# Altium project Control-Board-v1.0.PrjPcb (part 6 of 7)
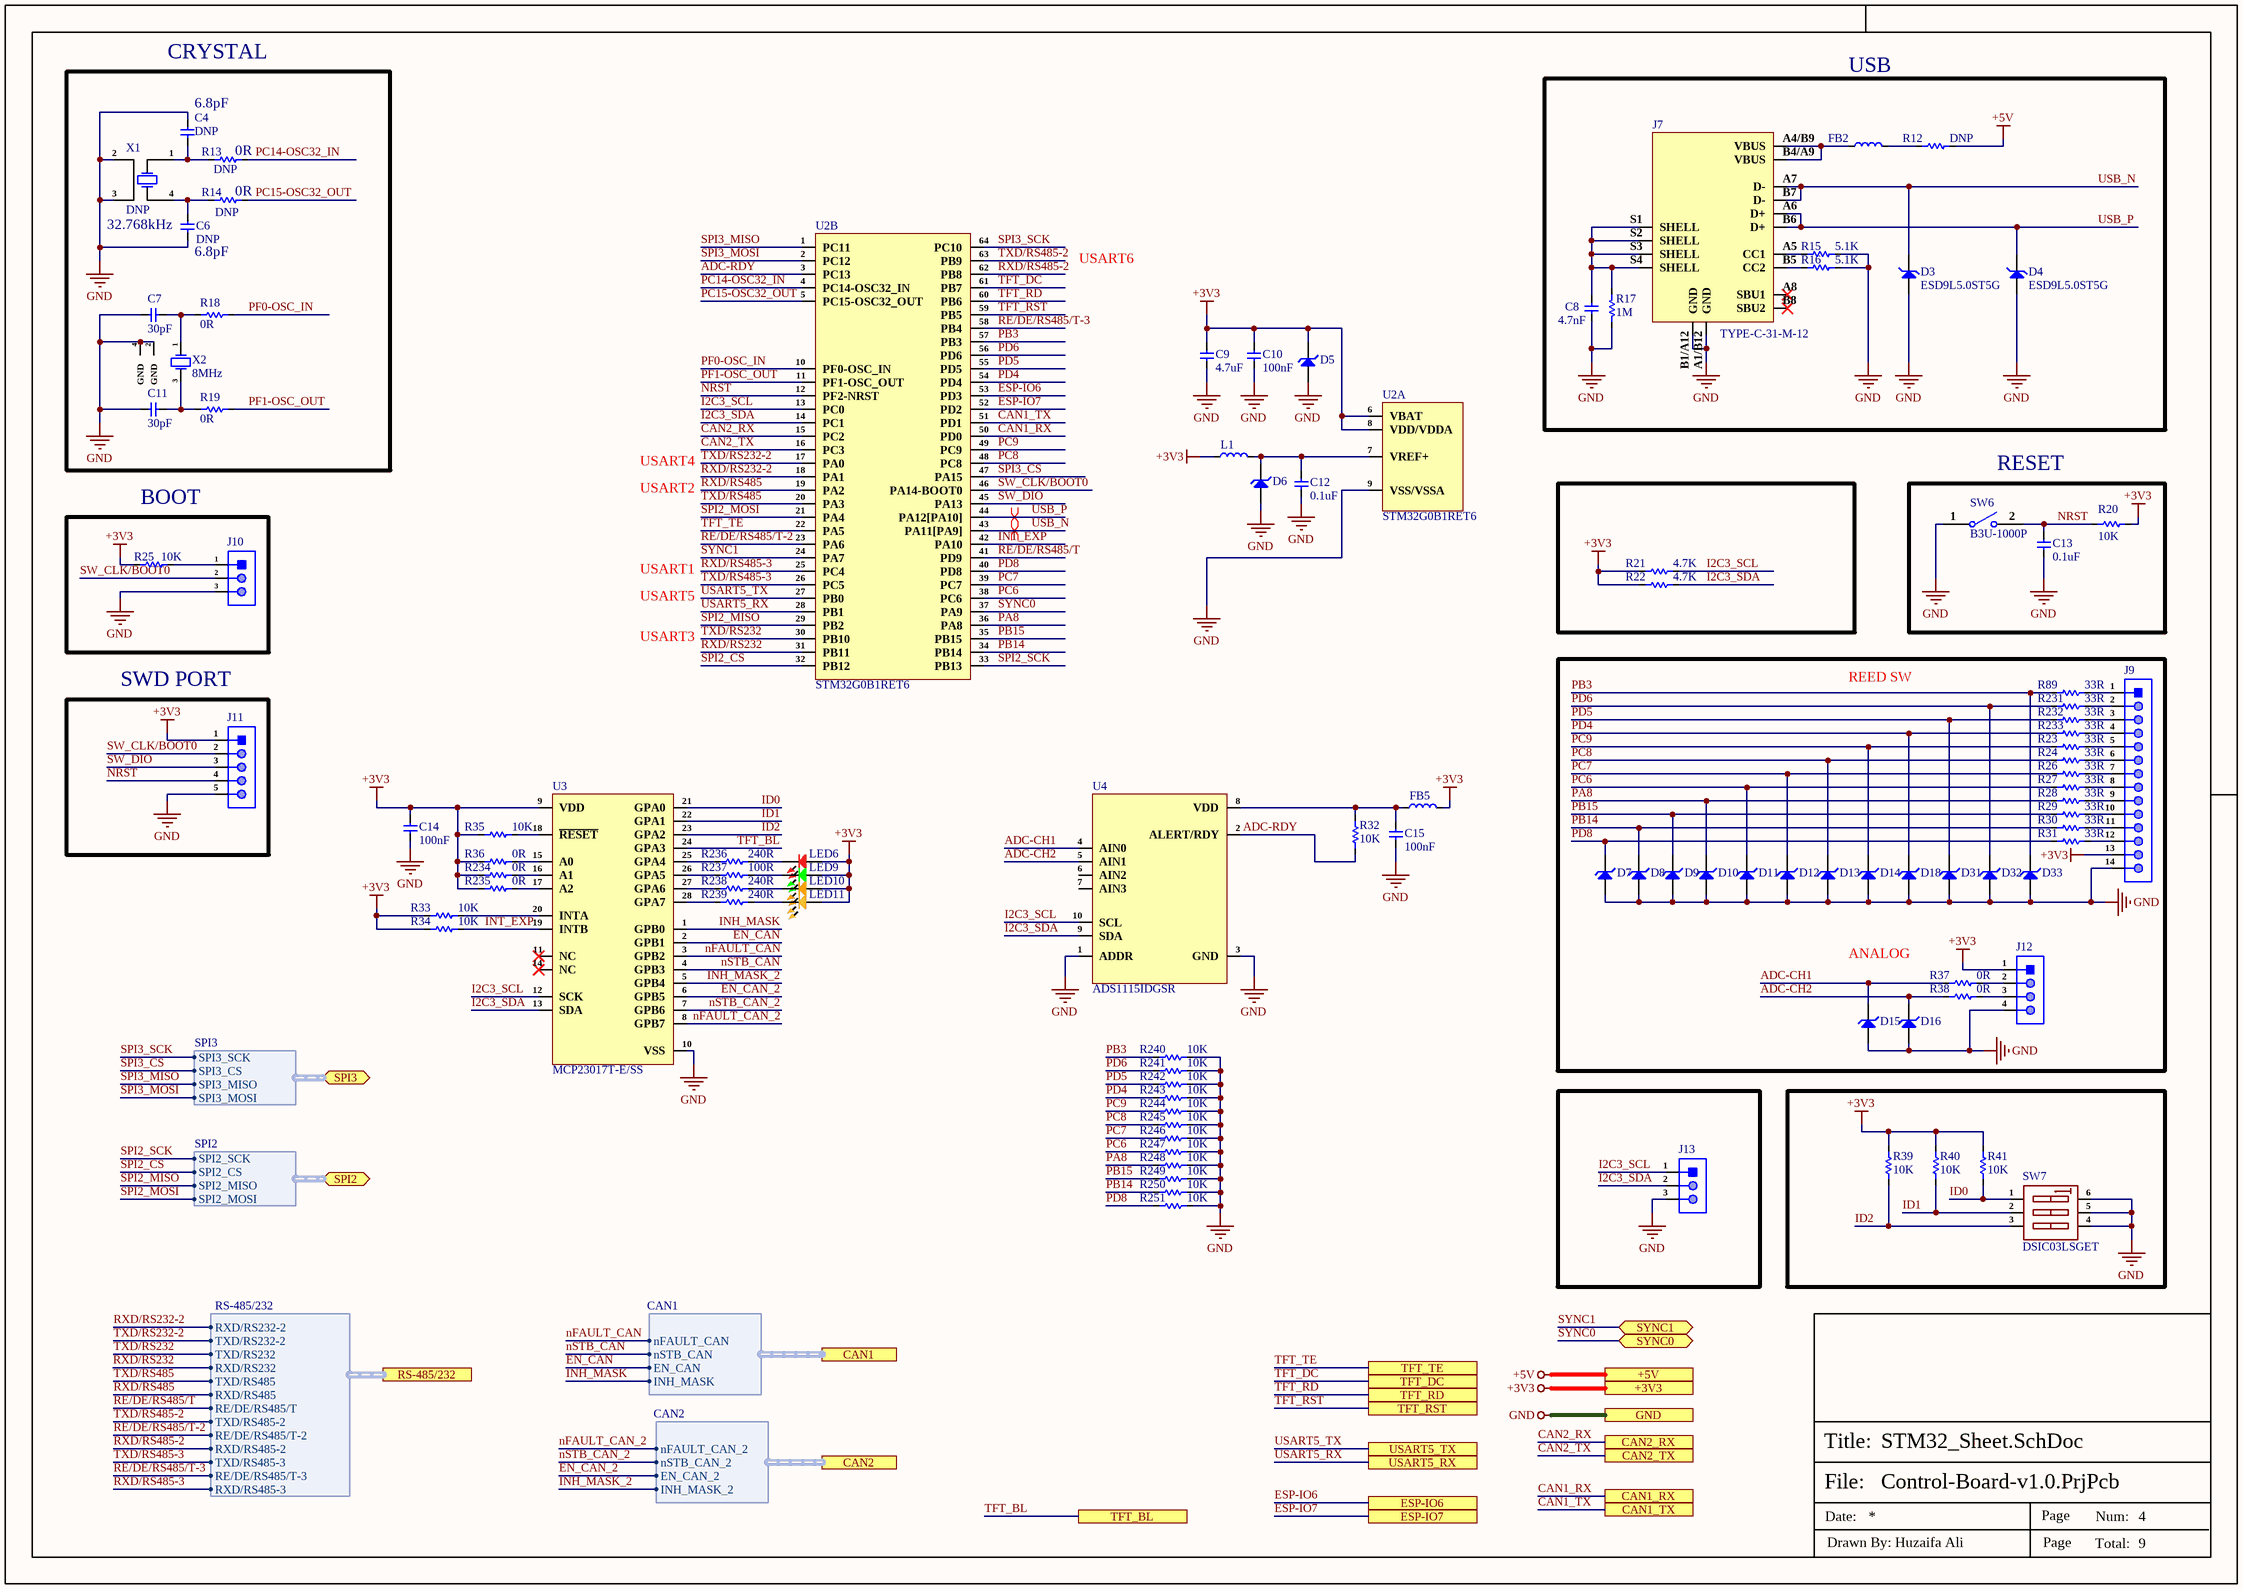
[diagram p11: STM32_Sheet.SchDoc]

## Sheet STM32_Sheet.SchDoc (continued)

### Library data of the parts (continued)
X1 = MC-306 32.7680K-A0:ROHS: 32.768kHz 12.5pF ±20ppm MC-306 Crystals ROHS; Manufacturer: Seiko Epson; Value: 32.786kHz; Manufacturer Part Number: MC-306 32.7680K-A0:ROHS; Item Type: Crystal; LCSC Part Number: C2650464; ComponentLink1Description: LCSC; ComponentLink1URL: https://www.lcsc.com/product-detail/Crystals_Seiko-Epson-MC-306-32-7680K-A0-ROHS_C2650464.html
X2 = 5TJ480000XYLBC: 8MHz 18pF ±10ppm SMD5032-4P Crystals ROHS; Manufacturer: JYJE; Manufacturer Part Number: 5TJ480000XYLBC; ComponentLink1Description: LCSC; ComponentLink1URL: https://www.lcsc.com/product-detail/Crystals_JYJE-5TJ480000XYLBC_C2149247.html; Package: SMD5032-4P; LCSC Part Number: C2149247; Item Type: Crystal

## Sheet EtherCAT_Sheet.SchDoc
size 420 x 297 mm; SheetNumber: 7; SheetTotal: 8
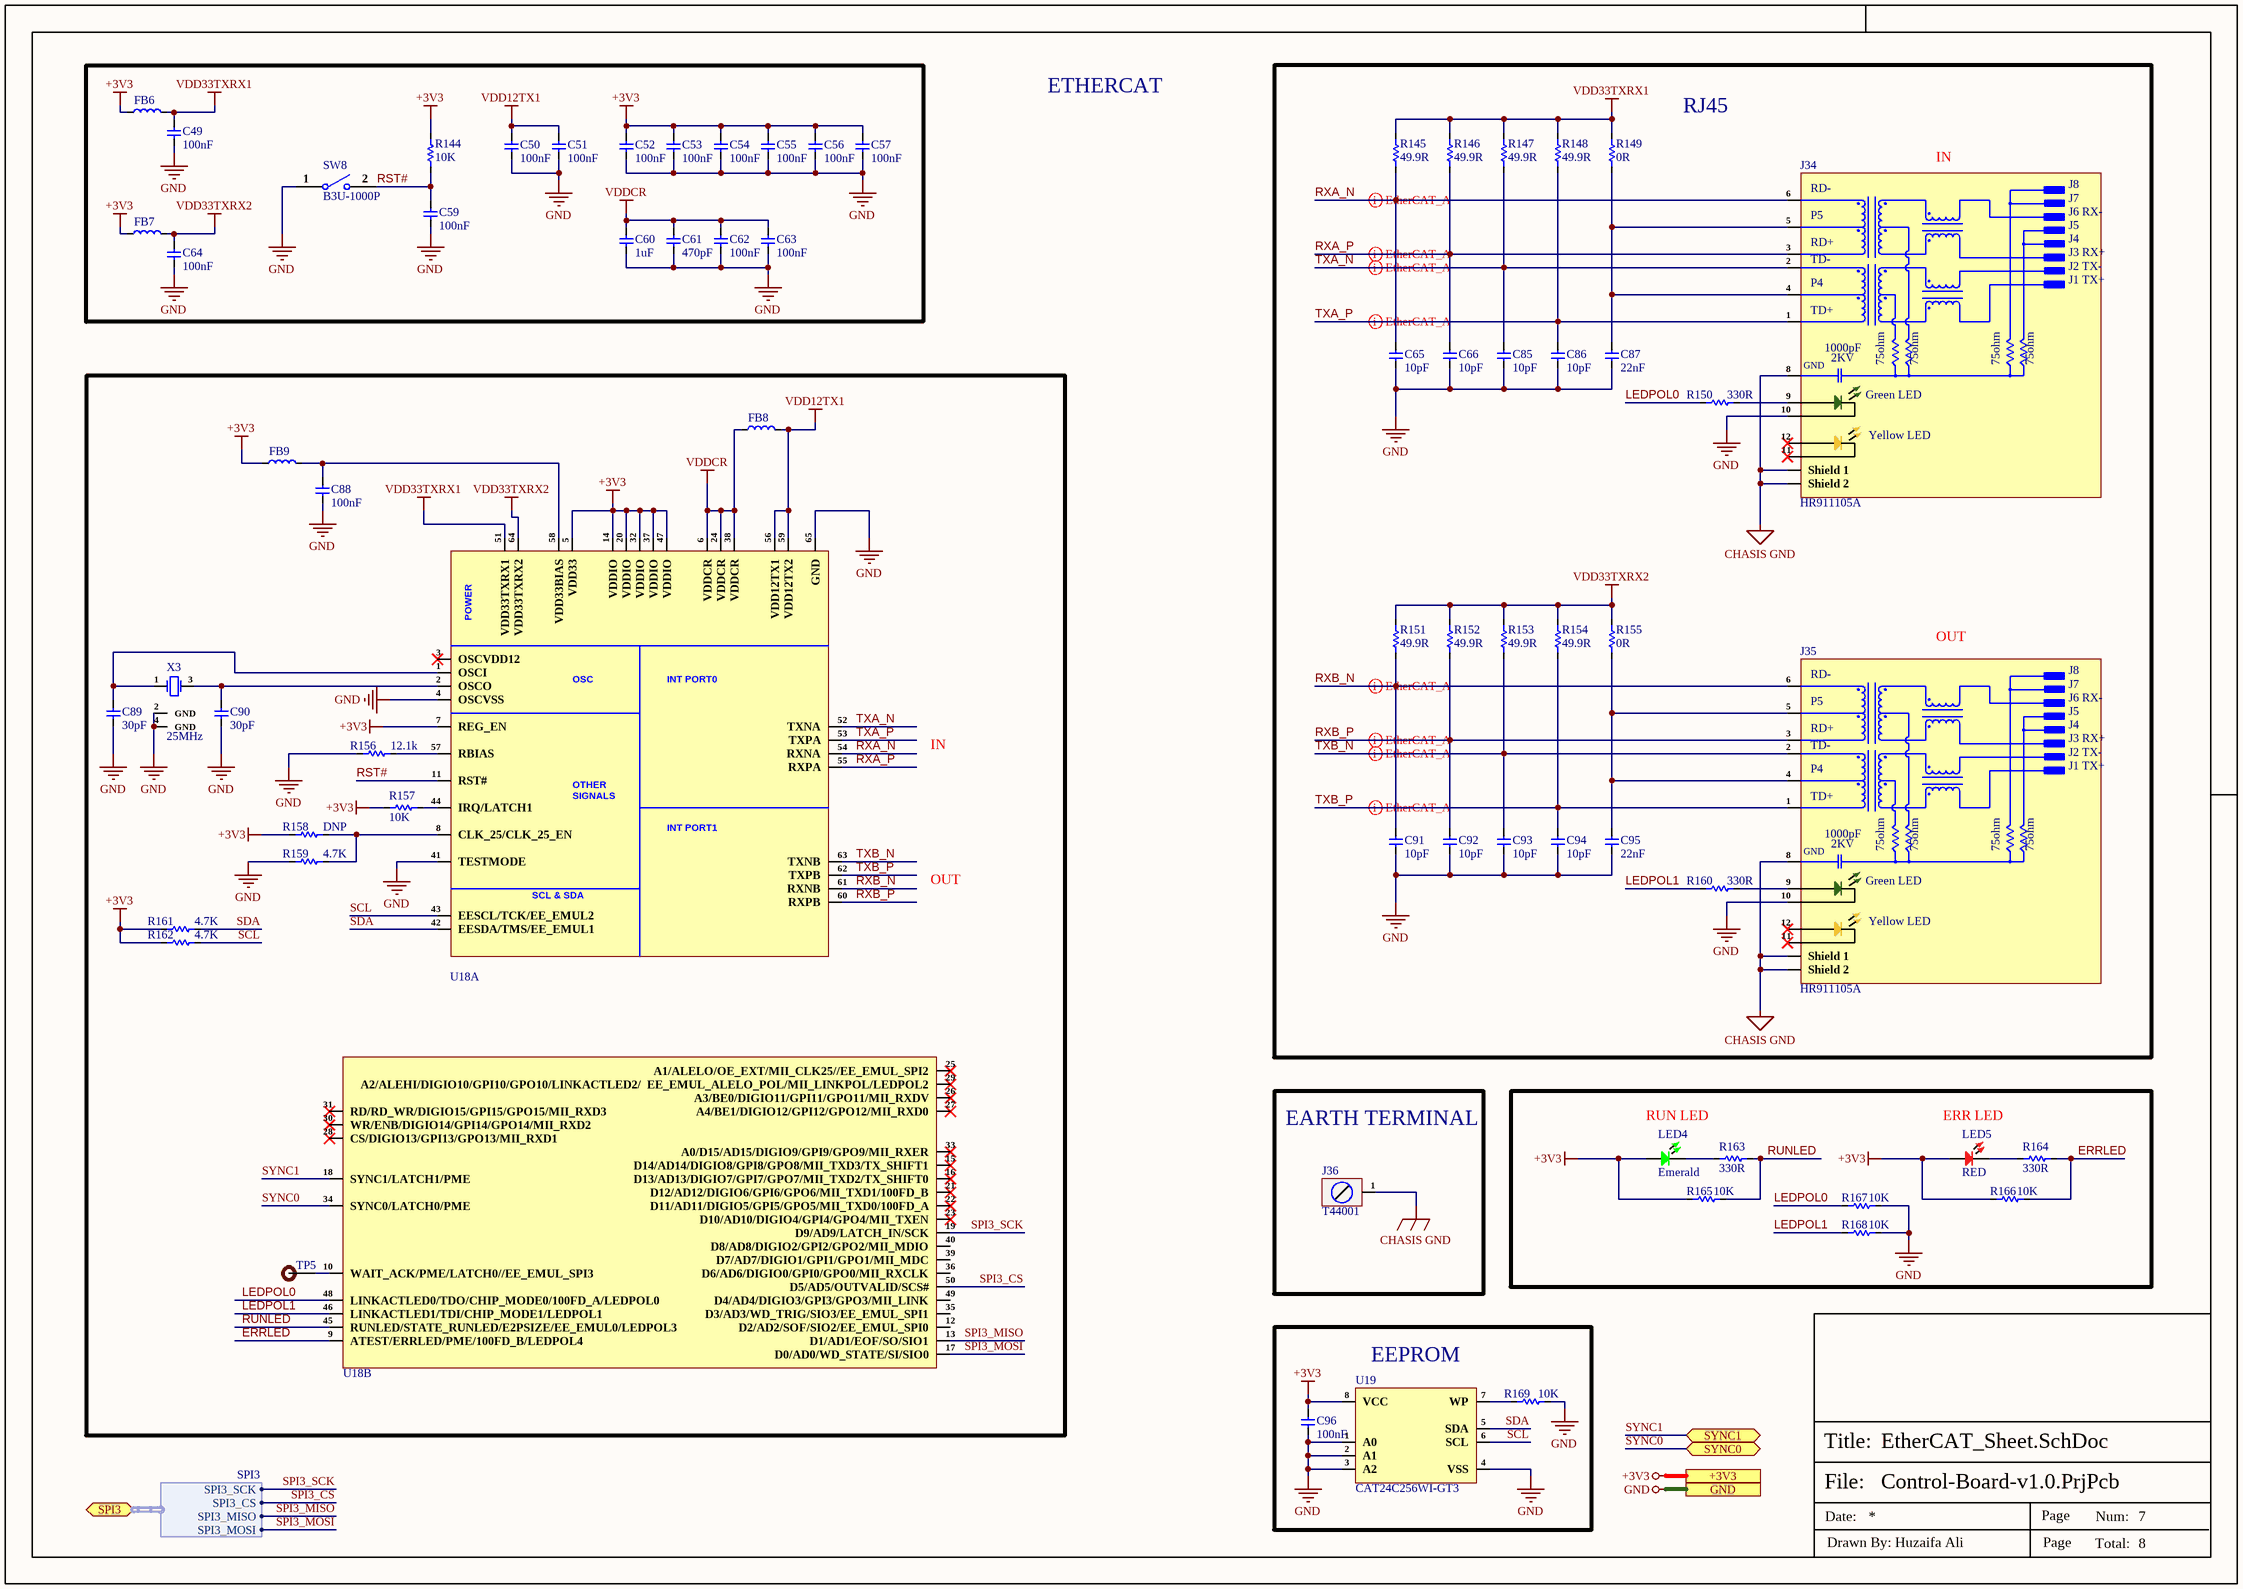
[diagram p7: EtherCAT_Sheet.SchDoc]

### Parts
C49  100nF  [cap-0402]
C50  100nF  [cap-0402]
C51  100nF  [cap-0402]
C52  100nF  [cap-0402]
C53  100nF  [cap-0402]
C54  100nF  [cap-0402]
C55  100nF  [cap-0402]
C56  100nF  [cap-0402]
C57  100nF  [cap-0402]
C59  100nF  [cap-0402]
C60  1uF  [Cap-0402]
C61  470pF  [Cap-0402]
C62  100nF  [cap-0402]
C63  100nF  [cap-0402]
C64  100nF  [cap-0402]
C65  10pF  [Cap-0402]
C66  10pF  [Cap-0402]
C85  10pF  [Cap-0402]
C86  10pF  [Cap-0402]
C87  22nF  [Cap-0402]
C88  100nF  [cap-0402]
C89  30pF  [Cap-0402]
C90  30pF  [Cap-0402]
C91  10pF  [Cap-0402]
C92  10pF  [Cap-0402]
C93  10pF  [Cap-0402]
C94  10pF  [Cap-0402]
C95  22nF  [Cap-0402]
C96  100nF  [cap-0402]
FB6  BLM18PG221SN1D  [IND-0603 (1608 Metric)]  (value not drawn)
FB7  BLM18PG221SN1D  [IND-0603 (1608 Metric)]  (value not drawn)
FB8  BLM18PG221SN1D  [IND-0603 (1608 Metric)]  (value not drawn)
FB9  BLM18PG221SN1D  [IND-0603 (1608 Metric)]  (value not drawn)
J34  HR911105A  [HR911105A]
J35  HR911105A  [HR911105A]
J36  T44001  [T44001]
LED4  Emerald  [LED-0603]
LED5  RED  [LED-0603]
R144  10K  [Res-0402]
R145  49.9R  [Res-0603]
R146  49.9R  [Res-0603]
R147  49.9R  [Res-0603]
R148  49.9R  [Res-0603]
R149  0R  [Res-0402]
R150  330R  [Res-0603]
R151  49.9R  [Res-0603]
R152  49.9R  [Res-0603]
R153  49.9R  [Res-0603]
R154  49.9R  [Res-0603]
R155  0R  [Res-0402]
R156  12.1k  [Res-0402]
R157  10K  [Res-0402]
R158  DNP  [Res-0402]
R159  4.7K  [Res-0402]
R160  330R  [Res-0603]
R161  4.7K  [Res-0402]
R162  4.7K  [Res-0402]
R163  330R  [Res-0603]
R164  330R  [Res-0603]
R165  10K  [Res-0402]
R166  10K  [Res-0402]
R167  10K  [Res-0402]
R168  10K  [Res-0402]
R169  10K  [Res-0201]
SW8  B3U-1000P  [B3U-1000P]
TP5  TEST POINT  [Test-point]  (value not drawn)  (no BOM)
U18  LAN9253-SVB QFN64  [QFN-64-EP(9x9)]  (value not drawn)  (parts A,B of 2)
U19  CAT24C256WI-GT3  [CAT24C256WI-GT3]
X3  25MHz  [SMD3225-4P]

### Blocks framed on the sheet
RJ45: C65 C66 C85-C87 C91-C95 J34 J35 R145-R155 R160
EARTH TERMINAL: J36
EEPROM: C96 R169 U19

### Ports
+3V3 (see CAN_Sheet[5D], ESP32_Sheet[5D], Ethernet_Sheet[5D], Power_Sheet[5D], RS485_RS232_Sheet[5D], STM32_Sheet[5D], TFT_Display_Sheet[5D]), GND (see CAN_Sheet[5D], ESP32_Sheet[5D], Ethernet_Sheet[5D], Power_Sheet[5D], RS485_RS232_Sheet[5D], STM32_Sheet[5D], TFT_Display_Sheet[5D]), SPI3 (bidir, harness SPI3, see STM32_Sheet[1C]), SYNC0 (bidir, see STM32_Sheet[5D]), SYNC1 (bidir, see STM32_Sheet[5D])

### Harnesses
SPI3: SPI3_SCK, SPI3_CS, SPI3_MISO, SPI3_MOSI

### Nets
+3V3: C52.2 C53.2 C54.2 C55.2 C56.2 C57.2 C96.2 FB6.1 FB7.1 FB9.1 LED4.1 LED5.1 R144.1 R157.1 R158.1 R161.2 R162.2 R165.2 R166.2 U18.5(VDD33) U18.7(REG_EN) U18.14(VDDIO) U18.20(VDDIO) U18.32(VDDIO) U18.37(VDDIO) U18.47(VDDIO) U19.8(VCC) ; port +3V3
CHASIS GND: J34.8(GND) J34.Shield_1 J34.Shield_2 J35.8(GND) J35.Shield_1 J35.Shield_2 J36.1
GND: C49.1 C50.1 C51.1 C52.1 C53.1 C54.1 C55.1 C56.1 C57.1 C59.1 C60.1 C61.1 C62.1 C63.1 C64.1 C65.1 C66.1 C85.1 C86.1 C87.1 C88.1 C89.1 C90.1 C91.1 C92.1 C93.1 C94.1 C95.1 C96.1 J34.10(CATHODE) J35.10(CATHODE) R156.1 R159.1 R167.1 R168.1 R169.2 SW8.1 U18.4(OSCVSS) U18.41(TESTMODE) U18.65(GND) U19.1(A0) U19.2(A1) U19.3(A2) U19.4(VSS) X3.2(GND) X3.4(GND) ; port GND
VDD12TX1: C50.2 C51.2 FB8.2 U18.56(VDD12TX1) U18.59(VDD12TX2)
VDD33TXRX1: C49.2 FB6.2 R145.2 R146.2 R147.2 R148.2 R149.2 U18.51(VDD33TXRX1)
VDD33TXRX2: C64.2 FB7.2 R151.2 R152.2 R153.2 R154.2 R155.2 U18.64(VDD33TXRX2)
VDDCR: C60.2 C61.2 C62.2 C63.2 FB8.1 U18.6(VDDCR) U18.24(VDDCR) U18.38(VDDCR)
ERRLED: R164.2 R166.1 U18.9(ATEST/ERRLED/PME/100FD_B/LEDPOL4)
LEDPOL0: R150.1 R167.2 U18.48(LINKACTLED0/TDO/CHIP_MODE0/100FD_A/LEDPOL0)
LEDPOL1: R160.1 R168.2 U18.46(LINKACTLED1/TDI/CHIP_MODE1/LEDPOL1)
RST#: C59.2 R144.2 SW8.2 U18.11(RST#)
RUNLED: R163.2 R165.1 U18.45(RUNLED/STATE_RUNLED/E2PSIZE/EE_EMUL0/LEDPOL3)
RXA_N: C65.2 J34.6(RD-) R145.1 U18.54(RXNA)
RXA_P: C66.2 J34.3(RD+) R146.1 U18.55(RXPA)
RXB_N: C91.2 J35.6(RD-) R151.1 U18.61(RXNB)
RXB_P: C92.2 J35.3(RD+) R152.1 U18.60(RXPB)
SCL: R162.1 U18.43(EESCL/TCK/EE_EMUL2) U19.6(SCL)
SDA: R161.1 U18.42(EESDA/TMS/EE_EMUL1) U19.5(SDA)
SPI3_CS: U18.50(D5/AD5/OUTVALID/SCS#) ; port SPI3.SPI3_CS
SPI3_MISO: U18.13(D1/AD1/EOF/SO/SIO1) ; port SPI3.SPI3_MISO
SPI3_MOSI: U18.17(D0/AD0/WD_STATE/SI/SIO0) ; port SPI3.SPI3_MOSI
SPI3_SCK: U18.19(D9/AD9/LATCH_IN/SCK) ; port SPI3.SPI3_SCK
SYNC0: U18.34(SYNC0/LATCH0/PME) ; port SYNC0
SYNC1: U18.18(SYNC1/LATCH1/PME) ; port SYNC1
TXA_N: C85.2 J34.2(TD-) R147.1 U18.52(TXNA)
TXA_P: C86.2 J34.1(TD+) R148.1 U18.53(TXPA)
TXB_N: C93.2 J35.2(TD-) R153.1 U18.63(TXNB)
TXB_P: C94.2 J35.1(TD+) R154.1 U18.62(TXPB)
NetC87_2: C87.2 J34.4(P4) J34.5(P5) R149.1
NetC88_2: C88.2 FB9.2 U18.58(VDD33BIAS)
NetC89_2: C89.2 U18.1(OSCI) X3.1(CRYSTAL)
NetC90_2: C90.2 U18.2(OSCO) X3.3(CRYSTAL)
NetC95_2: C95.2 J35.4(P4) J35.5(P5) R155.1
NetJ34_9: J34.9(ANODE) R150.2
NetJ35_9: J35.9(ANODE) R160.2
NetLED4_2: LED4.2 R163.1
NetLED5_2: LED5.2 R164.1
NetR156_2: R156.2 U18.57(RBIAS)
NetR157_2: R157.2 U18.44(IRQ/LATCH1)
NetR158_2: R158.2 R159.2 U18.8(CLK_25/CLK_25_EN)
NetR169_1: R169.1 U19.7(WP)
NetTP5_1: TP5.1 U18.10(WAIT_ACK/PME/LATCH0//EE_EMUL_SPI3)

Not connected (* = marked no-connect by the designer): J34 11(CATHODE)* 12(ANODE_)*; J35 11(CATHODE)* 12(ANODE_)*; U18 3(OSCVDD12)* 12(D2/AD2/SOF/SIO2/EE_EMUL_SPI0) 15(D14/AD14/DIGIO8/GPI8/GPO8/MII_TXD3/TX_SHIFT1)* 16(D13/AD13/DIGIO7/GPI7/GPO7/MII_TXD2/TX_SHIFT0)* 21(D12/AD12/DIGIO6/GPI6/GPO6/MII_TXD1/100FD_B)* 22(D11/AD11/DIGIO5/GPI5/GPO5/MII_TXD0/100FD_A)* 23(D10/AD10/DIGIO4/GPI4/GPO4/MII_TXEN)* 25(A1/ALELO/OE_EXT/MII_CLK25//EE_EMUL_SPI2)* 26(A3/BE0/DIGIO11/GPI11/GPO11/MII_RXDV)* 27(A4/BE1/DIGIO12/GPI12/GPO12/MII_RXD0)* 28(CS/DIGIO13/GPI13/GPO13/MII_RXD1)* 29(A2/ALEHI/DIGIO10/GPI10/GPO10/LINKACTLED2/__EE_EMUL_ALELO_POL/MII_LINKPOL/LEDPOL2)* 30(WR/ENB/DIGIO14/GPI14/GPO14/MII_RXD2)* 31(RD/RD_WR/DIGIO15/GPI15/GPO15/MII_RXD3)* 33(A0/D15/AD15/DIGIO9/GPI9/GPO9/MII_RXER)* 35(D3/AD3/WD_TRIG/SIO3/EE_EMUL_SPI1) 36(D6/AD6/DIGIO0/GPI0/GPO0/MII_RXCLK) 39(D7/AD7/DIGIO1/GPI1/GPO1/MII_MDC) 40(D8/AD8/DIGIO2/GPI2/GPO2/MII_MDIO) 49(D4/AD4/DIGIO3/GPI3/GPO3/MII_LINK)

### Layout directives
differential pair; differential pair class EtherCAT_A_Lines; net class EtherCAT_A; rule Matched Net Lengths [Tolerance = 25.4mil]; rule Impedance Constraint [Min = 85.00    Max = 95.00    ]: RXA_N, RXA_P, RXB_N, RXB_P, TXA_N, TXA_P, TXB_N, TXB_P

### Notes on the sheet
- ETHERCAT
- IN
- OUT
- RUN LED
- ERR LED
- File:
- Title:
- Date:
- Page
- Num:
- Total:
- Drawn By: Huzaifa Ali
- (in symbol HR911105A) J8; J7; J6 RX-; J5; J4; J3 RX+; J2 TX-; J1 TX+; 1000pF; 2KV; 75ohm; Green LED; Yellow LED
- (in symbol LAN9253-SVB QFN64, part A) POWER; OSC; INT PORT0; OTHER / SIGNALS; INT PORT1; SCL & SDA

### Library data of the parts
C49-C57 C59 C62-C64 C88 C96 = C1005X7R1H104KT000F: CAP CER 0.1UF 50V X7R 0402; Manufacturer: TDK; Tolerance: 10%; Voltage: 25V; Item Type: Capacitor; Supplier 1: Avnet; Manufacturer Part Number: C1005X7R1H104KT000F; RoHS: No; Category: Ceramic Capacitors; Dielectric: X7R; Supplier Part Number 1: C1005X7R1H104KT000F; LCSC Part Number: C361198; ComponentLink1Description: LCSC; ComponentLink1URL: https://www.lcsc.com/product-detail/Multilayer-Ceramic-Capacitors-MLCC-SMD-SMT_TDK-C1005X7R1H104KT000F_C361198.html
C60 = CC0402KRX5R7BB105: CAP CER 1UF 16V X5R 0402; Manufacturer: Yageo; Tolerance: 10%; Item Type: Capacitor; Supplier 1: Digi-Key; Manufacturer Part Number: CC0402KRX5R7BB105; Stock 1: 1405667; Pricing 1: 1=0.36, 10=0.252, 100=0.1512, 500=0.1134, 1000=0.09576, 2500=0.09072, 5000=0.08568 (USD); Mount: Surface Mount; Case/Package: 0402; Weight: 2.3E-05oz; Case Code (Imperial): 0402; Case Code (Metric): 1005; Min Operating Temperature: -55°C; Max Operating Temperature: 85°C; Capacitance: 1uF; Dielectric: X5R; Packaging: Tape and Reel; Voltage Rating (DC): 16V; Voltage Rating: 16V; Termination: SMD/SMT; Composition: Ceramic; Length: 1mm; Height: 0.5mm; Width: 0.02inch; Thickness: 0.022inch; Depth: 0.5mm; Radiation Hardening: No; Lead Free: Lead Free; Halogen Free: Halogen Free; ComponentLink1URL: http://www.yageo.com/documents/recent/UPY-GPHC_X5R_4V-to-50V_12.pdf?src-supplier=Avnet+Europe; ComponentLink1Description: http://www.yageo.com/documents/recent/UPY-GPHC_X5R_4V-to-50V_12.pdf?src-supplier=Avnet+Europe; Supplier Part Number 1: 311-1691-6-ND; LCSC Part Number: C325464
C61 = GRM155R11H471KA01D: 50V 470pF ±10% 0402 Multilayer Ceramic Capacitors MLCC - SMD/SMT ROHS; Manufacturer: Murata Electronics; Manufacturer Part Number: GRM155R11H471KA01D; Package: 0402; LCSC Part Number: C576458; Item Type: Capacitor; ComponentLink1Description: LCSC; ComponentLink1URL: https://www.lcsc.com/product-detail/Multilayer-Ceramic-Capacitors-MLCC-SMD-SMT_Murata-Electronics-GRM155R11H471KA01D_C576458.html
C65 C66 C85 C86 C91-C94 = GRM1555C1H100JA01D: CAP CER 10PF 50V C0G/NP0 0402; Manufacturer: Murata; Material: Ceramic; Dielectric: C0G; Tolerance: 5%; Item Type: Capacitor; Supplier: Arrow Electronics; Supplier Part Number: GRM1555C1H100JA01D; Manufacturer Part Number: GRM1555C1H100JA01D; RoHS: Yes; Category: Ceramic Capacitors; Stock: 3860000; Pricing: 10000=0.0034, 50000=0.0027, 100000=0.0023, 250000=0.0021 (USD); Mounting Technology: Surface Mount; Case/Package: 0402; Case Code (Metric): 1005; Case Code (Imperial): 0402; Min Operating Temperature: -55°C; Max Operating Temperature: 125°C; Value: 10pF; Voltage Rating: 50V; Packaging: Tape and Reel; Package Quantity: 1; Voltage Rating (DC): 50V; Termination: SMD/SMT; Series: GRM; Voltage: 50V; Construction: Flat; Length: 1mm; Width: 0.02inch; Height: 0.5mm; Depth: 0.5mm; Thickness: 0.022inch; Radiation Hardening: No; RoHS Compliant: Yes; Lead Free: Lead Free; Reach SVHC Compliant: No; ComponentLink1URL: https://datasheet.ciiva.com/2989/product-2989280.pdf?src-supplier=Avnet; ComponentLink1Description: https://datasheet.ciiva.com/2989/product-2989280.pdf?src-supplier=Avnet; ComponentLink2URL: https://datasheet.ciiva.com/18184/getdatasheetpartid-307234-18184164.pdf?src-supplier=Verical; ComponentLink2Description: https://datasheet.ciiva.com/18184/getdatasheetpartid-307234-18184164.pdf?src-supplier=Verical; ComponentLink3URL: https://datasheet.ciiva.com/29200/453545-da-01-en-vs-kondensator-0402-29200107.pdf?src-supplier=Conrad; ComponentLink3Description: https://datasheet.ciiva.com/29200/453545-da-01-en-vs-kondensator-0402-29200107.pdf?src-supplier=Conrad; ComponentLink4URL: https://datasheet.ciiva.com/7828/1666664-7828812.pdf?src-supplier=Element14; ComponentLink4Description: https://datasheet.ciiva.com/7828/1666664-7828812.pdf?src-supplier=Element14; ComponentLink5URL: https://datasheet.ciiva.com/6271/partnumbering-e-01-6271159.pdf?src-supplier=Digi-Key; ComponentLink5Description: https://datasheet.ciiva.com/6271/partnumbering-e-01-6271159.pdf?src-supplier=Digi-Key; ComponentLink6URL: https://datasheet.ciiva.com/6271/partnumbering-e-01-6271158.pdf?src-supplier=Digi-Key; ComponentLink6Description: https://datasheet.ciiva.com/6271/partnumbering-e-01-6271158.pdf?src-supplier=Digi-Key; ComponentLink7URL: https://datasheet.ciiva.com/6271/partnumbering-e-01-6271068.pdf?src-supplier=Digi-Key; ComponentLink7Description: https://datasheet.ciiva.com/6271/partnumbering-e-01-6271068.pdf?src-supplier=Digi-Key; LCSC Part Number: C76946
C87 C95 = CC0402JRX7R7BB223: CAP CER 0.022UF 16V X7R 0402; Manufacturer: Yageo; Tolerance: 5%; Item Type: Capacitor; Supplier: Digikey; Supplier Part Number: 311-3758-1-ND; Manufacturer Part Number: CC0402JRX7R7BB223; RoHS: Yes; Category: Ceramic Capacitors; Stock: 4203; Pricing: 1=0.1, 10=0.033, 50=0.0192, 100=0.0149, 500=0.0112, 1000=0.0088, 2500=0.008, 5000=0.00736 (USD); Mounting Technology: Surface Mount; Case/Package: 0402; Case Code (Imperial): 0402; Case Code (Metric): 1005; Weight: 2.3E-05oz; Min Operating Temperature: -55°C; Max Operating Temperature: 125°C; Value: 22nF; Packaging: Tape and Reel; Voltage Rating: 16V; Voltage Rating (DC): 16V; Dielectric: X7R; Termination: SMD/SMT; Series: CC; Length: 0.039inch; Width: 0.5mm; Thickness: 0.022inch; RoHS Compliant: Yes; Halogen Free: 5694HalogenFree; Lead Free: 5697LeadFree; ComponentLink1URL: https://datasheet.ciiva.com/13264/upy-gphc-x7r-6-3v-to-50v-8-12304-13264039.pdf?src-supplier=Mouser; ComponentLink1Description: https://datasheet.ciiva.com/13264/upy-gphc-x7r-6-3v-to-50v-8-12304-13264039.pdf?src-supplier=Mouser; LCSC Part Number: C541459
C89 C90 = CC0402GRNPO9BN300: CAP CER 30PF 50V C0G/NPO 0402; Manufacturer: Yageo; Item Type: Capacitor; Tolerance: 2%; Dielectric: C0G; Supplier: Digikey; LCSC Part Number: C277479; Manufacturer Part Number: CC0402GRNPO9BN300; RoHS: Yes; Stock: 114930; Pricing: 1=0.1, 10=0.052, 50=0.0296, 100=0.023, 500=0.01728, 1000=0.01358, 2500=0.01235, 5000=0.01136 (USD); Mounting Technology: Surface Mount; Case/Package: 0402; Case Code (Imperial): 0402; Case Code (Metric): 1005; Weight: 2.3E-05oz; Min Operating Temperature: -55°C; Max Operating Temperature: 125°C; Value: 30pF; Voltage Rating (DC): 50V; Packaging: Tape and Reel; Termination: SMD/SMT; Voltage Rating: 50V; Series: CC; Length: 0.039inch; Width: 0.02inch; Thickness: 0.022inch; Halogen Free: 5694HalogenFree; Lead Free: 5697LeadFree; ComponentLink1URL: https://datasheet.ciiva.com/13263/upy-gp-np0-16v-to-50v-8-3714-13263350.pdf?src-supplier=Mouser; ComponentLink1Description: https://datasheet.ciiva.com/13263/upy-gp-np0-16v-to-50v-8-3714-13263350.pdf?src-supplier=Mouser
FB6-FB9 = BLM18PG221SN1D: FERRITE BEAD 220 OHM 0603 1LN; Manufacturer: Murata; Manufacturer Series: BLM18P; Material: Steel,Ferrite; Value: 100mR; Impedance: 220R; Tolerance: 25%; Current Rating: 1.4A; Number of Lines: 1; Test Frequency: 100MHz; Shielding: Unshielded; Supplier: Digikey; LCSC Part Number: C80165; Manufacturer Part Number: BLM18PG221SN1D; RoHS: Yes; Item Type: Ferrite Bead; Stock: 134052; Pricing: 1=0.1, 10=0.078, 25=0.0712, 50=0.064, 100=0.0469, 250=0.03412, 500=0.03128, 1000=0.02701 (USD); Case/Package: 0603; Pins: 2; Core Material: Ferrite; Case Code (Metric): 1608; Case Code (Imperial): 0603; Weight: 7.1E-05oz; Min Operating Temperature: -55°C; Max Operating Temperature: 125°C; Package Quantity: 1; Packaging: Tape and Reel; ESR (Equivalent Series Resistance): 220R; Max Current Rating: 1.4A; DC Resistance (DCR): 100mR; Termination: SMD/SMT; Max DC Current: 1.4A; DC Current: 1.4A; Number of Circuits: 1; Series: BLM18P; Channels: 1; DC Resistance-Max: 100mR; RMS Current (Irms): 1.4A; ESR: 100mR; Length: 1.6mm; Width: 0.8mm; Height: 0.8mm; Depth: 0.8mm; Radiation Hardening: No; Reach SVHC Compliant: No; Lead Free: Lead Free; RoHS Compliant: Yes; ComponentLink1URL: https://datasheet.ciiva.com/19458/1845030-19458417.pdf?src-supplier=Jameco; ComponentLink1Description: https://datasheet.ciiva.com/19458/1845030-19458417.pdf?src-supplier=Jameco; ComponentLink2URL: https://datasheet.ciiva.com/11800/0900766b81275ca5-11800851.pdf?src-supplier=Rs; ComponentLink2Description: https://datasheet.ciiva.com/11800/0900766b81275ca5-11800851.pdf?src-supplier=Rs; ComponentLink3URL: https://datasheet.ciiva.com/29347/442391-da-01-en-chip-drossel-0603-220r-1400ma-1-6x0-8mm-29347986.pdf?src-supplier=Conrad; ComponentLink3Description: https://datasheet.ciiva.com/29347/442391-da-01-en-chip-drossel-0603-220r-1400ma-1-6x0-8mm-29347986.pdf?src-supplier=Conrad; ComponentLink4URL: https://datasheet.ciiva.com/8021/5148-8021482.pdf?src-supplier=Element14; ComponentLink4Description: https://datasheet.ciiva.com/8021/5148-8021482.pdf?src-supplier=Element14; ComponentLink5URL: https://datasheet.ciiva.com/8021/5148-8021479.pdf?src-supplier=Element14; ComponentLink5Description: https://datasheet.ciiva.com/8021/5148-8021479.pdf?src-supplier=Element14; ComponentLink6URL: https://datasheet.ciiva.com/14122/blm-series-eng-tds-14122909.pdf?src-supplier=Distrelec; ComponentLink6Description: https://datasheet.ciiva.com/14122/blm-series-eng-tds-14122909.pdf?src-supplier=Distrelec; ComponentLink7URL: https://datasheet.ciiva.com/1012/l0110s0100blm18p-1012162.pdf?src-supplier=Digikey; ComponentLink7Description: https://datasheet.ciiva.com/1012/l0110s0100blm18p-1012162.pdf?src-supplier=Digikey; ComponentLink8URL: https://datasheet.ciiva.com/1012/l0110s0100blm18p-1012161.pdf?src-supplier=Digikey; ComponentLink8Description: https://datasheet.ciiva.com/1012/l0110s0100blm18p-1012161.pdf?src-supplier=Digikey; ComponentLink9URL: https://datasheet.ciiva.com/1012/l0110s0100blm18p-1012163.pdf?src-supplier=Digikey; ComponentLink9Description: https://datasheet.ciiva.com/1012/l0110s0100blm18p-1012163.pdf?src-supplier=Digikey; ComponentLink10URL: https://datasheet.ciiva.com/3081/l0110s0100blm18p-3081633.pdf?src-supplier=Avnet; ComponentLink10Description: https://datasheet.ciiva.com/3081/l0110s0100blm18p-3081633.pdf?src-supplier=Avnet; ComponentLink11URL: https://datasheet.ciiva.com/16205/l0110s0100blm18p-16205422.pdf?src-supplier=Future+Electronics; ComponentLink11Description: https://datasheet.ciiva.com/16205/l0110s0100blm18p-16205422.pdf?src-supplier=Future+Electronics
J34 J35 = HR911105A: RJ45 RJReceptacle 1 WithLED Plugin Ethernet Connectors/Modular Connectors (RJ45 RJ11) ROHS; Manufacturer: HANRUN; Item Type: RJ45 Connector; Manufacturer Part Number: HR911105A; Package: Plugin; LCSC Part Number: C12074; ComponentLink1Description: LCSC; ComponentLink1URL: https://www.lcsc.com/product-detail/Ethernet-Connectors-Modular-Connectors-RJ45-RJ11_HANRUN-Zhongshan-HanRun-Elec-HR911105A_C12074.html
J36 = T44001: M4 Plugin PCB Welding Terminal ROHS; Manufacturer: XFCN; Manufacturer Part Number: T44001; Package: Plugin; ComponentLink1Description: LCSC; ComponentLink1URL: *
LED4 = NCD0603G2: Emerald 0603 Light Emitting Diodes (LED) ROHS; Manufacturer: Foshan NationStar Optoelectronics; Manufacturer Part Number: NCD0603G2; Package: 0603; LCSC Part Number: C87326; Item Type: LED; ComponentLink1Description: LCSC; ComponentLink1URL: https://www.lcsc.com/product-detail/Light-Emitting-Diodes-LED_Foshan-NationStar-Optoelectronics-NCD0603G2_C87326.html
LED5 = NCD0603R3: RED LED 0603 Light Emitting Diodes; Manufacturer: Foshan NationStar Optoelectronics; Manufacturer Part Number: NCD0603R3; Package: 0603; Item Type: LED; LCSC Part Number: C3151730; ComponentLink1Description: LCSC; ComponentLink1URL: https://www.lcsc.com/product-detail/Light-Emitting-Diodes-LED_Foshan-NationStar-Optoelectronics-NCD0603R3_C3151730.html
R144 R157 R165-R168 = RC0402FR-0710KL: RES 10K OHM 1% 1/16W 0402; Manufacturer: Yageo; Resistance: 10kR; Voltage Rating (DC): 50V; Temperature Coefficient: 100ppm/°C; Power Rating: 62.5mW; Max Power Dissipation: 63mW; Item Type: Resistor; Supplier 1: Mouser; Manufacturer Part Number: RC0402FR-0710KL; RoHS: Yes; Category: Chip SMD Resistors; Stock 1: 18648329; Pricing 1: 1=0.10000, 10=0.01400, 50=0.01400, 100=0.00500, 1000=0.00300, 10000=0.00200 (USD); Case/Package: 0402; Number of Pins: 2; Case Code (Imperial): 0402; Case Code (Metric): 1005; Min Operating Temperature: -55°C; Max Operating Temperature: 155°C; Resistor Type: Thick Film; Tolerance: 1%; Packaging: Tape and Reel; Voltage Rating: 50V; Termination: SMD/SMT; Working Voltage: 50V; Number of Terminations: 2; Features: Moisture Resistant; Series: RC; Resistance Tolerance: 1%; Construction: Rectangular; Length: 1mm; Width: 0.5mm; Height: 0.32mm; Depth: 0.5mm; Lead Pitch: 0.2mm; REACH SVHC: No SVHC; Lead Free: Lead Free; RoHS Compliant: Yes; Military Standard: Not; ComponentLink1URL: https://datasheet.ciiva.com/7660/38568-7660787.pdf?src-supplier=Element14; ComponentLink1Description: https://datasheet.ciiva.com/7660/38568-7660787.pdf?src-supplier=Element14; ComponentLink2URL: https://datasheet.ciiva.com/7849/1686128-7849814.pdf?src-supplier=Element14; ComponentLink2Description: https://datasheet.ciiva.com/7849/1686128-7849814.pdf?src-supplier=Element14; ComponentLink3URL: https://datasheet.ciiva.com/7983/1018594-7983486.pdf?src-supplier=Element14; ComponentLink3Description: https://datasheet.ciiva.com/7983/1018594-7983486.pdf?src-supplier=Element14; ComponentLink4URL: https://datasheet.ciiva.com/22747/1018594-22747512.pdf?src-supplier=Element14; ComponentLink4Description: https://datasheet.ciiva.com/22747/1018594-22747512.pdf?src-supplier=Element14; ComponentLink5URL: https://datasheet.ciiva.com/12667/pyu-rc0402-51-rohs-l-6-r-12667067.pdf?src-supplier=Mouser; ComponentLink5Description: https://datasheet.ciiva.com/12667/pyu-rc0402-51-rohs-l-6-r-12667067.pdf?src-supplier=Mouser; ComponentLink6URL: https://datasheet.ciiva.com/7849/1784430-7849813.pdf?src-supplier=Element14; ComponentLink6Description: https://datasheet.ciiva.com/7849/1784430-7849813.pdf?src-supplier=Element14; ComponentLink7URL: https://datasheet.ciiva.com/7849/1784430-7849815.pdf?src-supplier=Element14; ComponentLink7Description: https://datasheet.ciiva.com/7849/1784430-7849815.pdf?src-supplier=Element14; Supplier Part Number 1: 603-RC0402FR-0710KL; LCSC Part Number: C60490
R145-R148 R151-R154 = RC0603FR-0749R9L: RES 49.9 OHM 1% 1/10W 0603; Manufacturer: Yageo; Temperature Coefficient: 100ppm/°C; Voltage Rating (DC): 50V; Power Rating: 100mW; Item Type: Resistor; Supplier 1: Arrow Electronics; Manufacturer Part Number: RC0603FR-0749R9L; RoHS: Yes; Category: Chip SMD Resistors; Stock 1: 2075000; Pricing 1: 5000=0.00280 (USD); Case/Package: 0603; Number of Pins: 2; Case Code (Imperial): 0603; Case Code (Metric): 1608; Size Code: 0603; Min Operating Temperature: -55°C; Max Operating Temperature: 155°C; Tolerance: 1%; Resistance: 49.9R; Resistor Type: Thick Film; Packaging: Tape and Reel; Voltage Rating: 50V; Termination: SMD/SMT; Features: Moisture Resistant; Series: RC; Max Power Dissipation: 100mW; Number of Terminations: 2; Construction: Rectangular; Resistance Tolerance: 1%; Technology: THICK FILM; Length: 1.6mm; Height: 0.45mm; Depth: 0.8mm; Lead Free: Lead Free; REACH SVHC: No SVHC; Military Standard: Not; RoHS Compliant: Yes; ComponentLink1URL: https://datasheet.ciiva.com/11808/0900766b80f96399-11808223.pdf?src-supplier=RSComponents; ComponentLink1Description: https://datasheet.ciiva.com/11808/0900766b80f96399-11808223.pdf?src-supplier=RSComponents; ComponentLink2URL: https://datasheet.ciiva.com/22747/443971-22747527.pdf?src-supplier=Element14; ComponentLink2Description: https://datasheet.ciiva.com/22747/443971-22747527.pdf?src-supplier=Element14; ComponentLink3URL: https://datasheet.ciiva.com/15189/getdatasheetpartid-325421-15189750.pdf?src-supplier=Verical; ComponentLink3Description: https://datasheet.ciiva.com/15189/getdatasheetpartid-325421-15189750.pdf?src-supplier=Verical; Supplier Part Number 1: RC0603FR-0749R9L; LCSC Part Number: C114625
R149 R155 = AC0402FR-070RL: RESISTOR 0402 JUMPER ZERO OHM; Manufacturer: Yageo; Voltage Rating: 50V; Power Rating: 62.5mW; Tolerance: 1%; Temperature Coefficient: 200ppm/°C; Supplier: Digi-Key; Supplier Part Number: 13-AC0402FR-070RLDKR-ND; Manufacturer Part Number: AC0402FR-070RL; RoHS: Yes; Category: Chip SMD Resistors; Stock: 337140; Pricing: 1=0.1, 10=0.017, 25=0.0132, 50=0.01, 100=0.0071, 250=0.00568, 500=0.00454, 1000=0.00335, 5000=0.0024 (USD); Case/Package: 0402; Case Code (Imperial): 0402; Case Code (Metric): 1005; Min Operating Temperature: -55°C; Max Operating Temperature: 155°C; Value: 0R; Packaging: Tape and Reel; Termination: SMD/SMT; Series: AC; Height: 370um; ComponentLink1URL: https://datasheet.ciiva.com/12656/pyu-ac-51-rohs-l-2-12656734.pdf?src-supplier=Mouser; ComponentLink1Description: https://datasheet.ciiva.com/12656/pyu-ac-51-rohs-l-2-12656734.pdf?src-supplier=Mouser; LCSC Part Number: C226739; Item Type: Resistor; ComponentLink2Description: LCSC; ComponentLink2URL: https://www.lcsc.com/product-detail/Chip-Resistor-Surface-Mount_YAGEO-AC0402FR-070RL_C226739.html
R150 R160 R163 R164 = RC0603JR-07330RL: RES  SMD 330R 100 mW 0603; Manufacturer: Yageo; Power Rating: 100mW; Tolerance: 5%; Voltage Rating (DC): 50V; Temperature Coefficient: 100ppm/°C; Item Type: Resistor; Supplier 1: Digi-Key; Manufacturer Part Number: RC0603JR-07330RL; RoHS: Yes; Category: Chip SMD Resistors; Stock 1: 1074593; Pricing 1: 1=0.10000, 10=0.02000, 100=0.00800, 1000=0.00360, 2500=0.00312 (USD); Case/Package: 0603; Number of Pins: 2; Case Code (Imperial): 0603; Case Code (Metric): 1608; Size Code: 0603; Min Operating Temperature: -55°C; Max Operating Temperature: 155°C; Resistance: 330R; Packaging: Tape and Reel; Voltage Rating: 50V; Package Quantity: 5000; Termination: SMD/SMT; Resistor Type: Thick Film; Features: Moisture Resistant; Series: RC; Max Power Dissipation: 100mW; Number of Terminations: 2; Resistance Tolerance: 5%; Construction: Rectangular; Length: 1.6mm; Width: 0.8mm; Height: 0.45mm; Depth: 0.8mm; REACH SVHC: No SVHC; Lead Free: Lead Free; Military Standard: Not; RoHS Compliant: Yes; Supplier Part Number 1: 311-330GRCT-ND; LCSC Part Number: C105879
R156 = RT0402BRD0712K1L: RES SMD 12.1KOHM 0.1% 1/16W 0402; Manufacturer: Yageo; Item Type: Resistor; Supplier: Future Electronics; Supplier Part Number: 2068365; Manufacturer Part Number: RT0402BRD0712K1L; RoHS: Yes; Category: Chip SMD Resistors; Stock: 60000; Pricing: 10000=0.0245, 20000=0.0217, 30000=0.0237, 50000=0.0233, 100000=0.0228, 200000=0.022 (USD); ComponentLink1URL: https://datasheet.ciiva.com/12812/pyu-rt-1-to-0-05-rohs-l-4-12812462.pdf?src-supplier=Mouser; ComponentLink1Description: https://datasheet.ciiva.com/12812/pyu-rt-1-to-0-05-rohs-l-4-12812462.pdf?src-supplier=Mouser; LCSC Part Number: C281773
R158 R159 R161 R162 = RC0402FR-074K7L: RES 4.7K OHM 1% 1/16W 0402; Manufacturer: Yageo; Voltage Rating (DC): 50V; Power Rating: 62.5mW; Resistance: 4.7kR; Temperature Coefficient: 100ppm/°C; Max Power Dissipation: 63mW; Item Type: Resistor; Supplier 1: Avnet; Manufacturer Part Number: RC0402FR-074K7L; RoHS: Yes; Category: Chip SMD Resistors; Stock 1: 2420000; Pricing 1: 10000=0.00085 (USD); Case/Package: 0402; Number of Pins: 2; Case Code (Imperial): 0402; Case Code (Metric): 1005; Size Code: 0402; Min Operating Temperature: -55°C; Max Operating Temperature: 155°C; Tolerance: 1%; Voltage Rating: 50V; Packaging: Tape and Reel; Resistor Type: Thick Film; Termination: SMD/SMT; Features: Moisture Resistant; Series: RC; Number of Terminations: 2; Resistance Tolerance: 1%; Construction: Rectangular; Length: 1mm; Width: 0.5mm; Height: 0.32mm; Depth: 0.5mm; Height - Seated (Max): 0.016inch; RoHS Compliant: Yes; Reach SVHC Compliant: Yes; Military Standard: Not; Lead Free: Lead Free; ComponentLink1URL: https://datasheet.ciiva.com/22661/1686128-22661342.pdf?src-supplier=Element14; ComponentLink1Description: https://datasheet.ciiva.com/22661/1686128-22661342.pdf?src-supplier=Element14; ComponentLink2URL: https://datasheet.ciiva.com/7850/1018594-7850022.pdf?src-supplier=Element14; ComponentLink2Description: https://datasheet.ciiva.com/7850/1018594-7850022.pdf?src-supplier=Element14; ComponentLink3URL: https://datasheet.ciiva.com/7850/1018594-7850023.pdf?src-supplier=Element14; ComponentLink3Description: https://datasheet.ciiva.com/7850/1018594-7850023.pdf?src-supplier=Element14; ComponentLink4URL: https://datasheet.ciiva.com/15215/getdatasheetpartid-328119-15215035.pdf?src-supplier=Verical; ComponentLink4Description: https://datasheet.ciiva.com/15215/getdatasheetpartid-328119-15215035.pdf?src-supplier=Verical; Supplier Part Number 1: RC0402FR-074K7L; LCSC Part Number: C105871
R169 = RC0201FR-0710KL: RES SMD 10K OHM 1% 1/20W 0201; Manufacturer: Yageo; Item Type: Resistor; Manufacturer Part Number: RC0201FR-0710KL; Package: 0201; ComponentLink7Description: LCSC; ComponentLink7URL: https://www.lcsc.com/product-detail/Chip-Resistor-Surface-Mount_YAGEO-RC0201FR-0710KL_C106225.html; LCSC Part Number: C106225
SW8 = B3U-1000P: SWITCH TACTILE SPST-NO 0.05A 12V; Manufacturer: Omron; Mechanical Life: 200000Cycles; Operating Force: 1.5N; Throw Configuration: SPST; Current Rating: 50mA; Contact Resistance: 100mR; Illumination Type: Non-Illuminated,Illuminated; Switch Travel: 0.15mm; Switch Function: Off-Mom; Actuator Type: Standard; Actuator Length: 0.4mm; Ratings: Dust Proof,IP40; ComponentLink1URL: http://www.farnell.com/datasheets/60838.pdf?src-supplier=Farnell; ComponentLink1Description: http://www.farnell.com/datasheets/60838.pdf?src-supplier=Farnell; ComponentLink2URL: http://www.farnell.com/datasheets/60838.pdf?src-supplier=Element14; ComponentLink2Description: http://www.farnell.com/datasheets/60838.pdf?src-supplier=Element14; ComponentLink3URL: https://omronfs.omron.com/en_US/ecb/products/pdf/en-b3u.pdf?src-supplier=Digi-Key; ComponentLink3Description: https://omronfs.omron.com/en_US/ecb/products/pdf/en-b3u.pdf?src-supplier=Digi-Key; ComponentLink4URL: http://www.omron.com/ecb/products/pdf/en-b3u.pdf?src-supplier=Digi-Key; ComponentLink4Description: http://www.omron.com/ecb/products/pdf/en-b3u.pdf?src-supplier=Digi-Key; ComponentLink5URL: https://www.distrelec.biz/Web/Downloads/he/et/B3U_eng_datasheet.pdf?mime=application%2Fpdf&src-supplier=Distrelec; ComponentLink5Description: https://www.distrelec.biz/Web/Downloads/he/et/B3U_eng_datasheet.pdf?mime=application%2Fpdf&src-supplier=Distrelec; ComponentLink6URL: http://www.onlinecomponents.com/productFiles/mf-OM/en-b3u.pdf?src-supplier=Onlinecomponents.com; ComponentLink6Description: http://www.onlinecomponents.com/productFiles/mf-OM/en-b3u.pdf?src-supplier=Onlinecomponents.com; Supplier 1: Digi-Key; Manufacturer Part Number: B3U-1000P; Stock 1: 116454; Pricing 1: 1=1, 10=0.961, 25=0.9064, 50=0.7976, 100=0.7251, 250=0.68888, 500=0.67074, 1000=0.52571 (USD); Mount: Surface Mount; Weight: 0.000776oz; Contact Material: Silver; Min Operating Temperature: -25°C; Max Operating Temperature: 70°C; Packaging: Tape and Reel; Voltage Rating (DC): 12V; Package Quantity: 1; Max Current Rating: 50mA; Termination: SMD/SMT; Orientation: Straight; Max Voltage Rating (DC): 12V; Electrical Life: 200000Cycles; Insulation Resistance: 100MR; Contact Current Rating: 50mA; Length: 4mm; Height: 1.2mm; Depth: 2.5mm; Width: 3mm; REACH SVHC: Unknown; Lead Free: Lead Free; ComponentLink7URL: https://www.verical.com/server-webapp/html/getDatasheet?partID=552554&src-supplier=Verical; ComponentLink7Description: https://www.verical.com/server-webapp/html/getDatasheet?partID=552554&src-supplier=Verical; ComponentLink8URL: http://www.farnell.com/datasheets/1685550.pdf?src-supplier=Element14; ComponentLink8Description: http://www.farnell.com/datasheets/1685550.pdf?src-supplier=Element14; ComponentLink9URL: http://www.farnell.com/datasheets/2610940.pdf?src-supplier=Farnell; ComponentLink9Description: http://www.farnell.com/datasheets/2610940.pdf?src-supplier=Farnell; ComponentLink10URL: https://www.alliedelec.com/m/d/4c8a9ef82804fc3c241a13c1e298fd73.pdf?src-supplier=Allied+Electronics; ComponentLink10Description: https://www.alliedelec.com/m/d/4c8a9ef82804fc3c241a13c1e298fd73.pdf?src-supplier=Allied+Electronics; Supplier Part Number 1: SW1020DKR-ND; LCSC Part Number: C231329; Item Type: Switch
TP5 = TEST POINT: Test Point ON; Item Type: TEST POINT
U18 = LAN9253-SVB QFN64: 2/3-PORT ETHERCAT SLAVE CTLR; Manufacturer: Microchip; Manufacturer Part Number: LAN9253-I/R4X; Item Type: IC; Revision: 2; ComponentLink1Description: SVN Datasheet; ComponentLink2Description: Local Datasheet; ComponentLink5Description: Open Footprint 2; ComponentLink6Description: Open Footprint 3; Supplier: Digikey; Supplier Part Number: 150-LAN9253-I/R4X-ND; RoHS: Yes; Stock: 364; Pricing: 1=13.43, 25=11.2, 100=10.825 (USD)
U19 = CAT24C256WI-GT3: IC EEPROM 256KBIT I2C 1MHZ 8SOIC; Manufacturer: ON Semiconductor; Interface: I2C,Serial,2-Wire; Access Time: 900ns; Max Supply Voltage: 5.5V; Min Supply Voltage: 1.8V; Frequency: 400kHz; Memory Size: 256Kb; Number of Words: 32000; Operating Supply Voltage: 5V; Nominal Supply Current: 3mA; Write Cycle Time-Max (tWC): 5ms; Write Protection: YES; Organization: 32KX8; Supplier 1: RSComponents; Manufacturer Part Number: CAT24C256WI-GT3; RoHS: Yes; Category: EEPROM; Stock 1: 300; Pricing 1: 100=0.19900, 200=0.19400, 500=0.18900, 1000=0.18400 (GBP); Mount: Surface Mount; Case/Package: SOIC; Number of Pins: 8; Contact Plating: Gold; Min Operating Temperature: -40°C; Max Operating Temperature: 85°C; Packaging: Tape and Reel; Density: 256Kb; Package Quantity: 1; Memory Type: EEPROM; Max Frequency: 400kHz; Series: -; Supply Voltage-Nom: 5.5V; Access Time-Max: 900ns; Supply Current: 3mA; Length: 5mm; Width: 4mm; Height: 1.5mm; Radiation Hardening: No; Lead Free: Lead Free; Halogen Free: Halogen Free; REACH SVHC: No SVHC; RoHS Compliant: Yes; ComponentLink1URL: https://datasheet.ciiva.com/8072/1780696-8072142.pdf?src-supplier=Element14; ComponentLink1Description: https://datasheet.ciiva.com/8072/1780696-8072142.pdf?src-supplier=Element14; ComponentLink2URL: https://datasheet.ciiva.com/46391/1792913-46391371.pdf?src-supplier=Element14; ComponentLink2Description: https://datasheet.ciiva.com/46391/1792913-46391371.pdf?src-supplier=Element14; ComponentLink3URL: https://datasheet.ciiva.com/4859/cat24c256-d-105771-4859816.pdf?src-supplier=Mouser; ComponentLink3Description: https://datasheet.ciiva.com/4859/cat24c256-d-105771-4859816.pdf?src-supplier=Mouser; ComponentLink4URL: https://datasheet.ciiva.com/16427/cat24c256-d-16427973.pdf?src-supplier=Future+Electronics; ComponentLink4Description: https://datasheet.ciiva.com/16427/cat24c256-d-16427973.pdf?src-supplier=Future+Electronics; Supplier Part Number 1: 8080199P
X3 = X322525MRB4SI: 25MHz 贴片晶振 18pF ±10ppm ±20ppm SMD3225-4P Crystals ROHS; Manufacturer: YXC; Supplier: LCSC; LCSC Part Number: C70593; Manufacturer Part Number: X322525MRB4SI; RoHS: No; Item Type: Crystal

## Sheet Ethernet_Sheet.SchDoc
size 420 x 297 mm; SheetNumber: 9; SheetTotal: 9
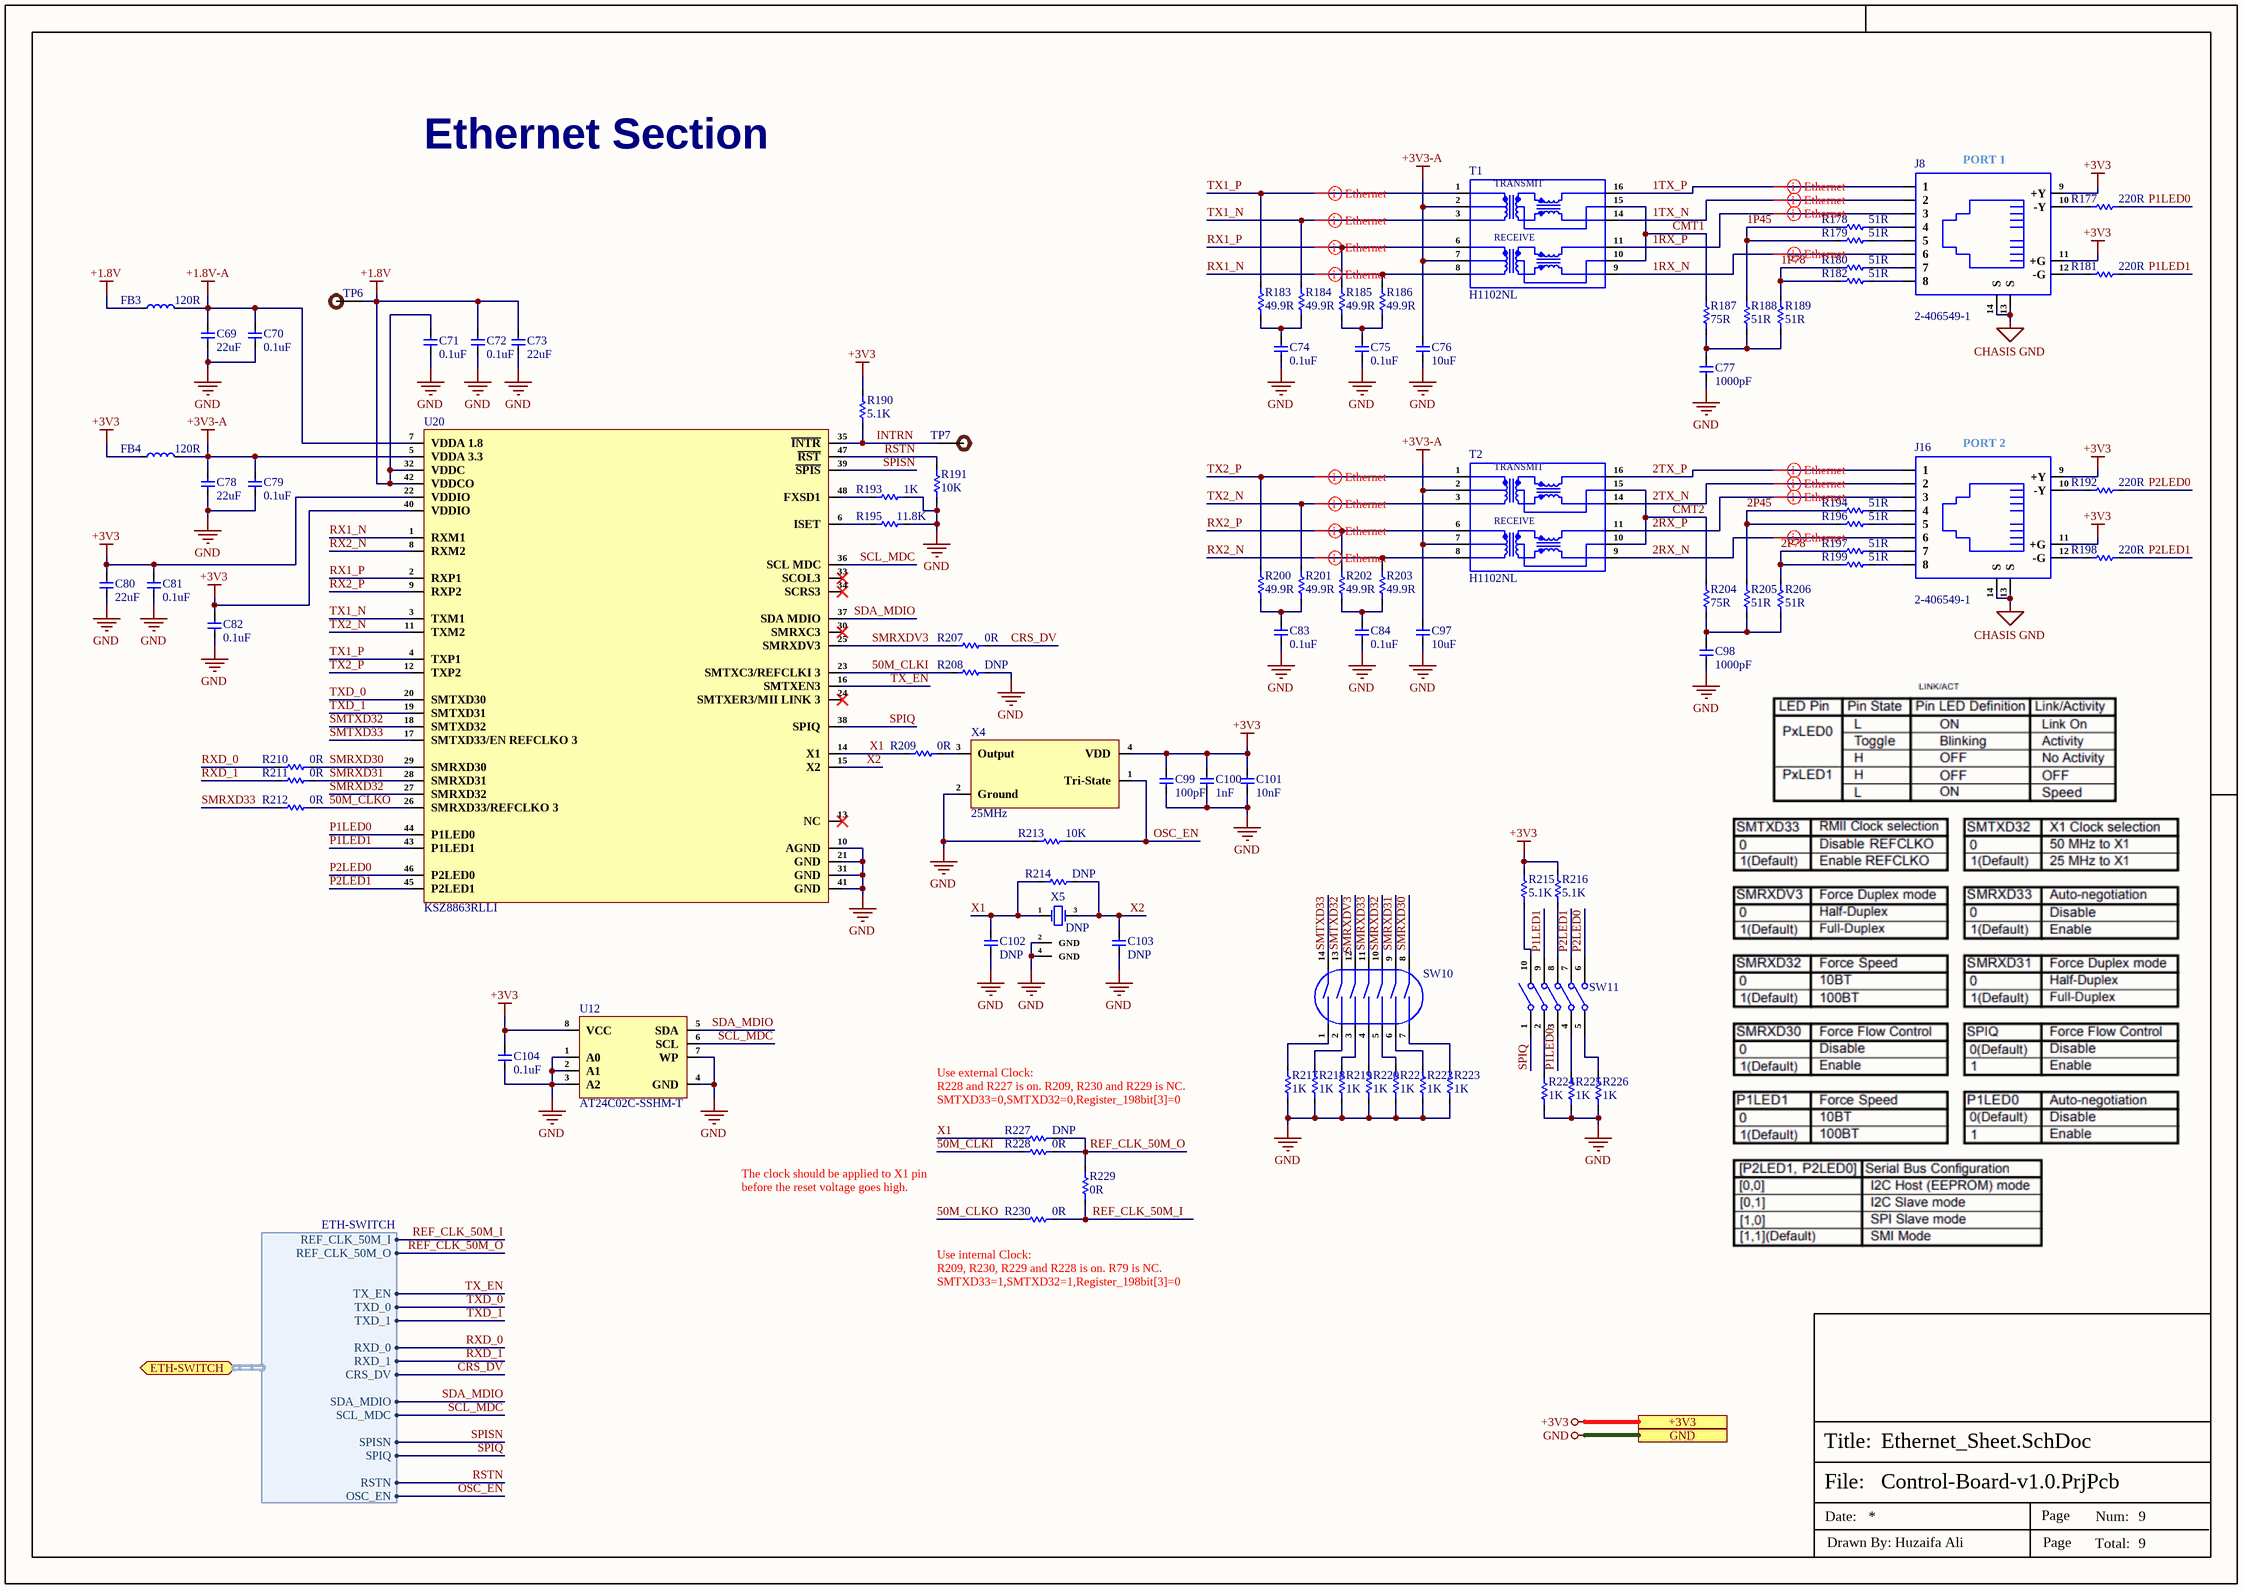
[diagram p8: Ethernet_Sheet.SchDoc]

### Parts
C69  22uF  [Cap-0805]
C70  0.1uF  [Cap-0402]
C71  0.1uF  [Cap-0402]
C72  0.1uF  [Cap-0402]
C73  22uF  [Cap-0805]
C74  0.1uF  [Cap-0402]
C75  0.1uF  [Cap-0402]
C76  10uF  [Cap-0603]
C77  1000pF  [Cap-1206]
C78  22uF  [Cap-0805]
C79  0.1uF  [Cap-0402]
C80  22uF  [Cap-0805]
C81  0.1uF  [Cap-0402]
C82  0.1uF  [Cap-0402]
C83  0.1uF  [Cap-0402]
C84  0.1uF  [Cap-0402]
C97  10uF  [Cap-0603]
C98  1000pF  [Cap-1206]
C99  100pF  [Cap-0402]
C100  1nF  [Cap-0402]
C101  10nF  [Cap-0402]
C102  DNP  [Cap-0402]
C103  DNP  [Cap-0402]
C104  0.1uF  [Cap-0402]
FB3  120R  [IND-0603 (1608 Metric)]
FB4  120R  [IND-0603 (1608 Metric)]
J8  2-406549-1  [2-406549-1]
J16  2-406549-1  [2-406549-1]
R177  220R  [Res-0603]
R178  51R  [Res-0603]
R179  51R  [Res-0603]
R180  51R  [Res-0603]
R181  220R  [Res-0603]
R182  51R  [Res-0603]
R183  49.9R  [Res-0603]
R184  49.9R  [Res-0603]
R185  49.9R  [Res-0603]
R186  49.9R  [Res-0603]
R187  75R  [Res-0603]
R188  51R  [Res-0603]
R189  51R  [Res-0603]
R190  5.1K  [Res-0402]
R191  10K  [Res-0402]
R192  220R  [Res-0603]
R193  1K  [Res-0402]
R194  51R  [Res-0603]
R195  11.8K  [Res-0603]
R196  51R  [Res-0603]
R197  51R  [Res-0603]
R198  220R  [Res-0603]
R199  51R  [Res-0603]
R200  49.9R  [Res-0603]
R201  49.9R  [Res-0603]
R202  49.9R  [Res-0603]
R203  49.9R  [Res-0603]
R204  75R  [Res-0603]
R205  51R  [Res-0603]
R206  51R  [Res-0603]
R207  0R  [Res-0402]
R208  DNP  [Res-0402]
R209  0R  [Res-0402]
R210  0R  [Res-0402]
R211  0R  [Res-0402]
R212  0R  [Res-0402]
R213  10K  [Res-0402]
R214  DNP  [Res-0402]
R215  5.1K  [Res-0402]
R216  5.1K  [Res-0402]
R217  1K  [Res-0402]
R218  1K  [Res-0402]
R219  1K  [Res-0402]
R220  1K  [Res-0402]
R221  1K  [Res-0402]
R222  1K  [Res-0402]
R223  1K  [Res-0402]
R224  1K  [Res-0402]
R225  1K  [Res-0402]
R226  1K  [Res-0402]
R227  DNP  [Res-0402]
R228  0R  [Res-0402]
R229  0R  [Res-0402]
R230  0R  [Res-0402]
SW10  DSIC07LS-P  [DSIC07LS-P]  (value not drawn)
SW11  DSIC05LS-P  [DSIC05LS-P_]  (value not drawn)
T1  H1102NL  [H1102NLT]
T2  H1102NL  [H1102NLT]
TP6  TEST POINT 0.5mm Dia  [Test-point - 0.5mm]  (value not drawn)  (no BOM)
TP7  TEST POINT 0.5mm Dia  [Test-point - 0.5mm]  (value not drawn)  (no BOM)
U12  AT24C02C-SSHM-T  [SOIC-8(0.154", 3.90mm Width)]
U20  KSZ8863RLLI  [48-LQFP (7x7)]
X4  25MHz  [SMD2520-4P]
X5  DNP  [Q22FA12800090]

### Ports
+3V3 (see Top-Sheet[2B], CAN_Sheet[5D], ESP32_Sheet[5D], EtherCAT_Sheet[5D], Power_Sheet[5D], RS485_RS232_Sheet[5D], STM32_Sheet[5D], TFT_Display_Sheet[5D]), ETH-SWITCH (bidir, harness ETH-SWITCH, see Top-Sheet[2B], ESP32_Sheet[1D]), GND (see Top-Sheet[2B], CAN_Sheet[5D], ESP32_Sheet[5D], EtherCAT_Sheet[5D], Power_Sheet[5D], RS485_RS232_Sheet[5D], STM32_Sheet[5D], TFT_Display_Sheet[5D])

### Harnesses
ETH-SWITCH: REF_CLK_50M_I, REF_CLK_50M_O, TX_EN, TXD_0, TXD_1, RXD_0, RXD_1, CRS_DV, SDA_MDIO, SCL_MDC, SPISN, SPIQ, RSTN, OSC_EN

### Nets
+1.8V: C71.2 C72.2 C73.2 FB3.1 TP6.1 U20.32(VDDC) U20.42(VDDCO)
+1.8V-A: C69.2 C70.2 FB3.2 U20.7(VDDA_1.8)
+3V3: C80.2 C81.2 C82.2 C99.2 C100.2 C101.2 C104.2 FB4.1 J8.9(+Y) J8.11(+G) J16.9(+Y) J16.11(+G) R190.2 R215.2 R216.2 U12.8(VCC) U20.22(VDDIO) U20.40(VDDIO) X4.4(VDD) ; port +3V3
+3V3-A: C76.2 C78.2 C79.2 C97.2 FB4.2 T1.2 T1.7 T2.2 T2.7 U20.5(VDDA_3.3)
CHASIS GND: J8.13(S) J8.14(S) J16.13(S) J16.14(S)
GND: C69.1 C70.1 C71.1 C72.1 C73.1 C74.1 C75.1 C76.1 C77.1 C78.1 C79.1 C80.1 C81.1 C82.1 C83.1 C84.1 C97.1 C98.1 C99.1 C100.1 C101.1 C102.1 C103.1 C104.1 R191.1 R193.1 R195.2 R208.2 R213.1 R217.1 R218.1 R219.1 R220.1 R221.1 R222.1 R223.1 R224.1 R225.1 R226.1 U12.1(A0) U12.2(A1) U12.3(A2) U12.4(GND) U12.7(WP) U20.10(AGND) U20.21(GND) U20.31(GND) U20.41(GND) X4.2(Ground) X5.2(GND) X5.4(GND) ; port GND
1P45: R178.2 R179.2 R188.2
1P78: R180.2 R182.2 R189.2
1RX_N: J8.6 T1.9
1RX_P: J8.3 T1.11
1TX_N: J8.2 T1.14
1TX_P: J8.1 T1.16
2P45: R194.2 R196.2 R205.2
2P78: R197.2 R199.2 R206.2
2RX_N: J16.6 T2.9
2RX_P: J16.3 T2.11
2TX_N: J16.2 T2.14
2TX_P: J16.1 T2.16
50M_CLKI: R208.1 R228.1 U20.23(SMTXC3/REFCLKI_3)
50M_CLKO: R212.2 R230.1 U20.26(SMRXD33/REFCLKO_3)
CMT1: R187.2 T1.10 T1.15
CMT2: R204.2 T2.10 T2.15
CRS_DV: R207.2 ; port ETH-SWITCH.CRS_DV
INTRN: R190.1 TP7.1 U20.35(~{INTR})
OSC_EN: R213.2 X4.1(Tri-State) ; port ETH-SWITCH.OSC_EN
P1LED0: R177.2 SW11.3 U20.44(P1LED0)
P1LED1: R181.2 SW11.9 U20.43(P1LED1)
P2LED0: R192.2 SW11.6 U20.46(P2LED0)
P2LED1: R198.2 SW11.7 U20.45(P2LED1)
REF_CLK_50M_I: R229.1 R230.2 ; port ETH-SWITCH.REF_CLK_50M_I
REF_CLK_50M_O: R227.2 R228.2 R229.2 ; port ETH-SWITCH.REF_CLK_50M_O
RSTN: R191.2 U20.47(~{RST}) ; port ETH-SWITCH.RSTN
RX1_N: R186.2 T1.8 U20.1(RXM1)
RX1_P: R185.2 T1.6 U20.2(RXP1)
RX2_N: R203.2 T2.8 U20.8(RXM2)
RX2_P: R202.2 T2.6 U20.9(RXP2)
RXD_0: R210.1 ; port ETH-SWITCH.RXD_0
RXD_1: R211.1 ; port ETH-SWITCH.RXD_1
SCL_MDC: U12.6(SCL) U20.36(SCL_MDC) ; port ETH-SWITCH.SCL_MDC
SDA_MDIO: U12.5(SDA) U20.37(SDA_MDIO) ; port ETH-SWITCH.SDA_MDIO
SMRXD30: R210.2 SW10.8 U20.29(SMRXD30)
SMRXD31: R211.2 SW10.9 U20.28(SMRXD31)
SMRXD32: SW10.10 U20.27(SMRXD32)
SMRXD33: R212.1 SW10.11
SMRXDV3: R207.1 SW10.12 U20.25(SMRXDV3)
SMTXD32: SW10.13 U20.18(SMTXD32)
SMTXD33: SW10.14 U20.17(SMTXD33/EN_REFCLKO_3)
SPIQ: SW11.1 U20.38(SPIQ) ; port ETH-SWITCH.SPIQ
SPISN: U20.39(~{SPIS}) ; port ETH-SWITCH.SPISN
TX1_N: R184.2 T1.3 U20.3(TXM1)
TX1_P: R183.2 T1.1 U20.4(TXP1)
TX2_N: R201.2 T2.3 U20.11(TXM2)
TX2_P: R200.2 T2.1 U20.12(TXP2)
TX_EN: U20.16(SMTXEN3) ; port ETH-SWITCH.TX_EN
TXD_0: U20.20(SMTXD30) ; port ETH-SWITCH.TXD_0
TXD_1: U20.19(SMTXD31) ; port ETH-SWITCH.TXD_1
X1: C102.2 R209.1 R214.1 R227.1 U20.14(X1) X5.1(OSC1)
X2: C103.2 R214.2 U20.15(X2) X5.3(OSC2)
NetC74_2: C74.2 R183.1 R184.1
NetC75_2: C75.2 R185.1 R186.1
NetC77_2: C77.2 R187.1 R188.1 R189.1
NetC83_2: C83.2 R200.1 R201.1
NetC84_2: C84.2 R202.1 R203.1
NetC98_2: C98.2 R204.1 R205.1 R206.1
NetJ8_4: J8.4 R178.1
NetJ8_5: J8.5 R179.1
NetJ8_7: J8.7 R180.1
NetJ8_8: J8.8 R182.1
NetJ8_10: J8.10(-Y) R177.1
NetJ8_12: J8.12(-G) R181.1
NetJ16_4: J16.4 R194.1
NetJ16_5: J16.5 R196.1
NetJ16_7: J16.7 R197.1
NetJ16_8: J16.8 R199.1
NetJ16_10: J16.10(-Y) R192.1
NetJ16_12: J16.12(-G) R198.1
NetR193_2: R193.2 U20.48(FXSD1)
NetR195_1: R195.1 U20.6(ISET)
NetR209_2: R209.2 X4.3(Output)
NetR215_1: R215.1 SW11.10
NetR216_1: R216.1 SW11.8
NetR217_2: R217.2 SW10.1
NetR218_2: R218.2 SW10.2
NetR219_2: R219.2 SW10.3
NetR220_2: R220.2 SW10.4
NetR221_2: R221.2 SW10.5
NetR222_2: R222.2 SW10.6
NetR223_2: R223.2 SW10.7
NetR224_2: R224.2 SW11.2
NetR225_2: R225.2 SW11.4
NetR226_2: R226.2 SW11.5

Not connected (* = marked no-connect by the designer): U20 13(NC)* 24(SMTXER3/MII_LINK_3)* 30(SMRXC3)* 33(SCOL3)* 34(SCRS3)*

### Layout directives
differential pair; differential pair class Ethernet-1 A Lines; rule Impedance Constraint [Min = 97.00    Max = 103.0    ]; rule Matched Net Lengths [Tolerance = 0.508mm]: 1RX_N, 1RX_P, 1TX_N, 1TX_P
differential pair; differential pair class Ethernet-1 B Lines; rule Impedance Constraint [Min = 97.00    Max = 103.0    ]; rule Matched Net Lengths [Tolerance = 0.508mm]: RX1_N, RX1_P, TX1_N, TX1_P
differential pair; differential pair class Ethernet-2 A Lines; rule Impedance Constraint [Min = 97.00    Max = 103.0    ]; rule Matched Net Lengths [Tolerance = 0.508mm]: 2RX_N, 2RX_P, 2TX_N, 2TX_P
differential pair; differential pair class Ethernet-2 B Lines; rule Impedance Constraint [Min = 97.00    Max = 103.0    ]; rule Matched Net Lengths [Tolerance = 0.508mm]: RX2_N, RX2_P, TX2_N, TX2_P

### Notes on the sheet
- Ethernet Section
- (near J8) PORT 1
- (near J16) PORT 2
- Use external Clock:
  R228 and R227 is on. R209, R230 and R229 is NC.
  SMTXD33=0,SMTXD32=0,Register_198bit[3]=0
- The clock should be applied to X1 pin before the reset voltage goes high.
- (near R230) Use internal Clock:
  R209, R230, R229 and R228 is on. R79 is NC.
  SMTXD33=1,SMTXD32=1,Register_198bit[3]=0
- File:
- Title:
- Date:
- Page
- Num:
- Total:
- Drawn By: Huzaifa Ali
- (in symbol H1102NL) TRANSMIT; RECEIVE